# Altium schematic sheet SRAM.SchDoc
size A3
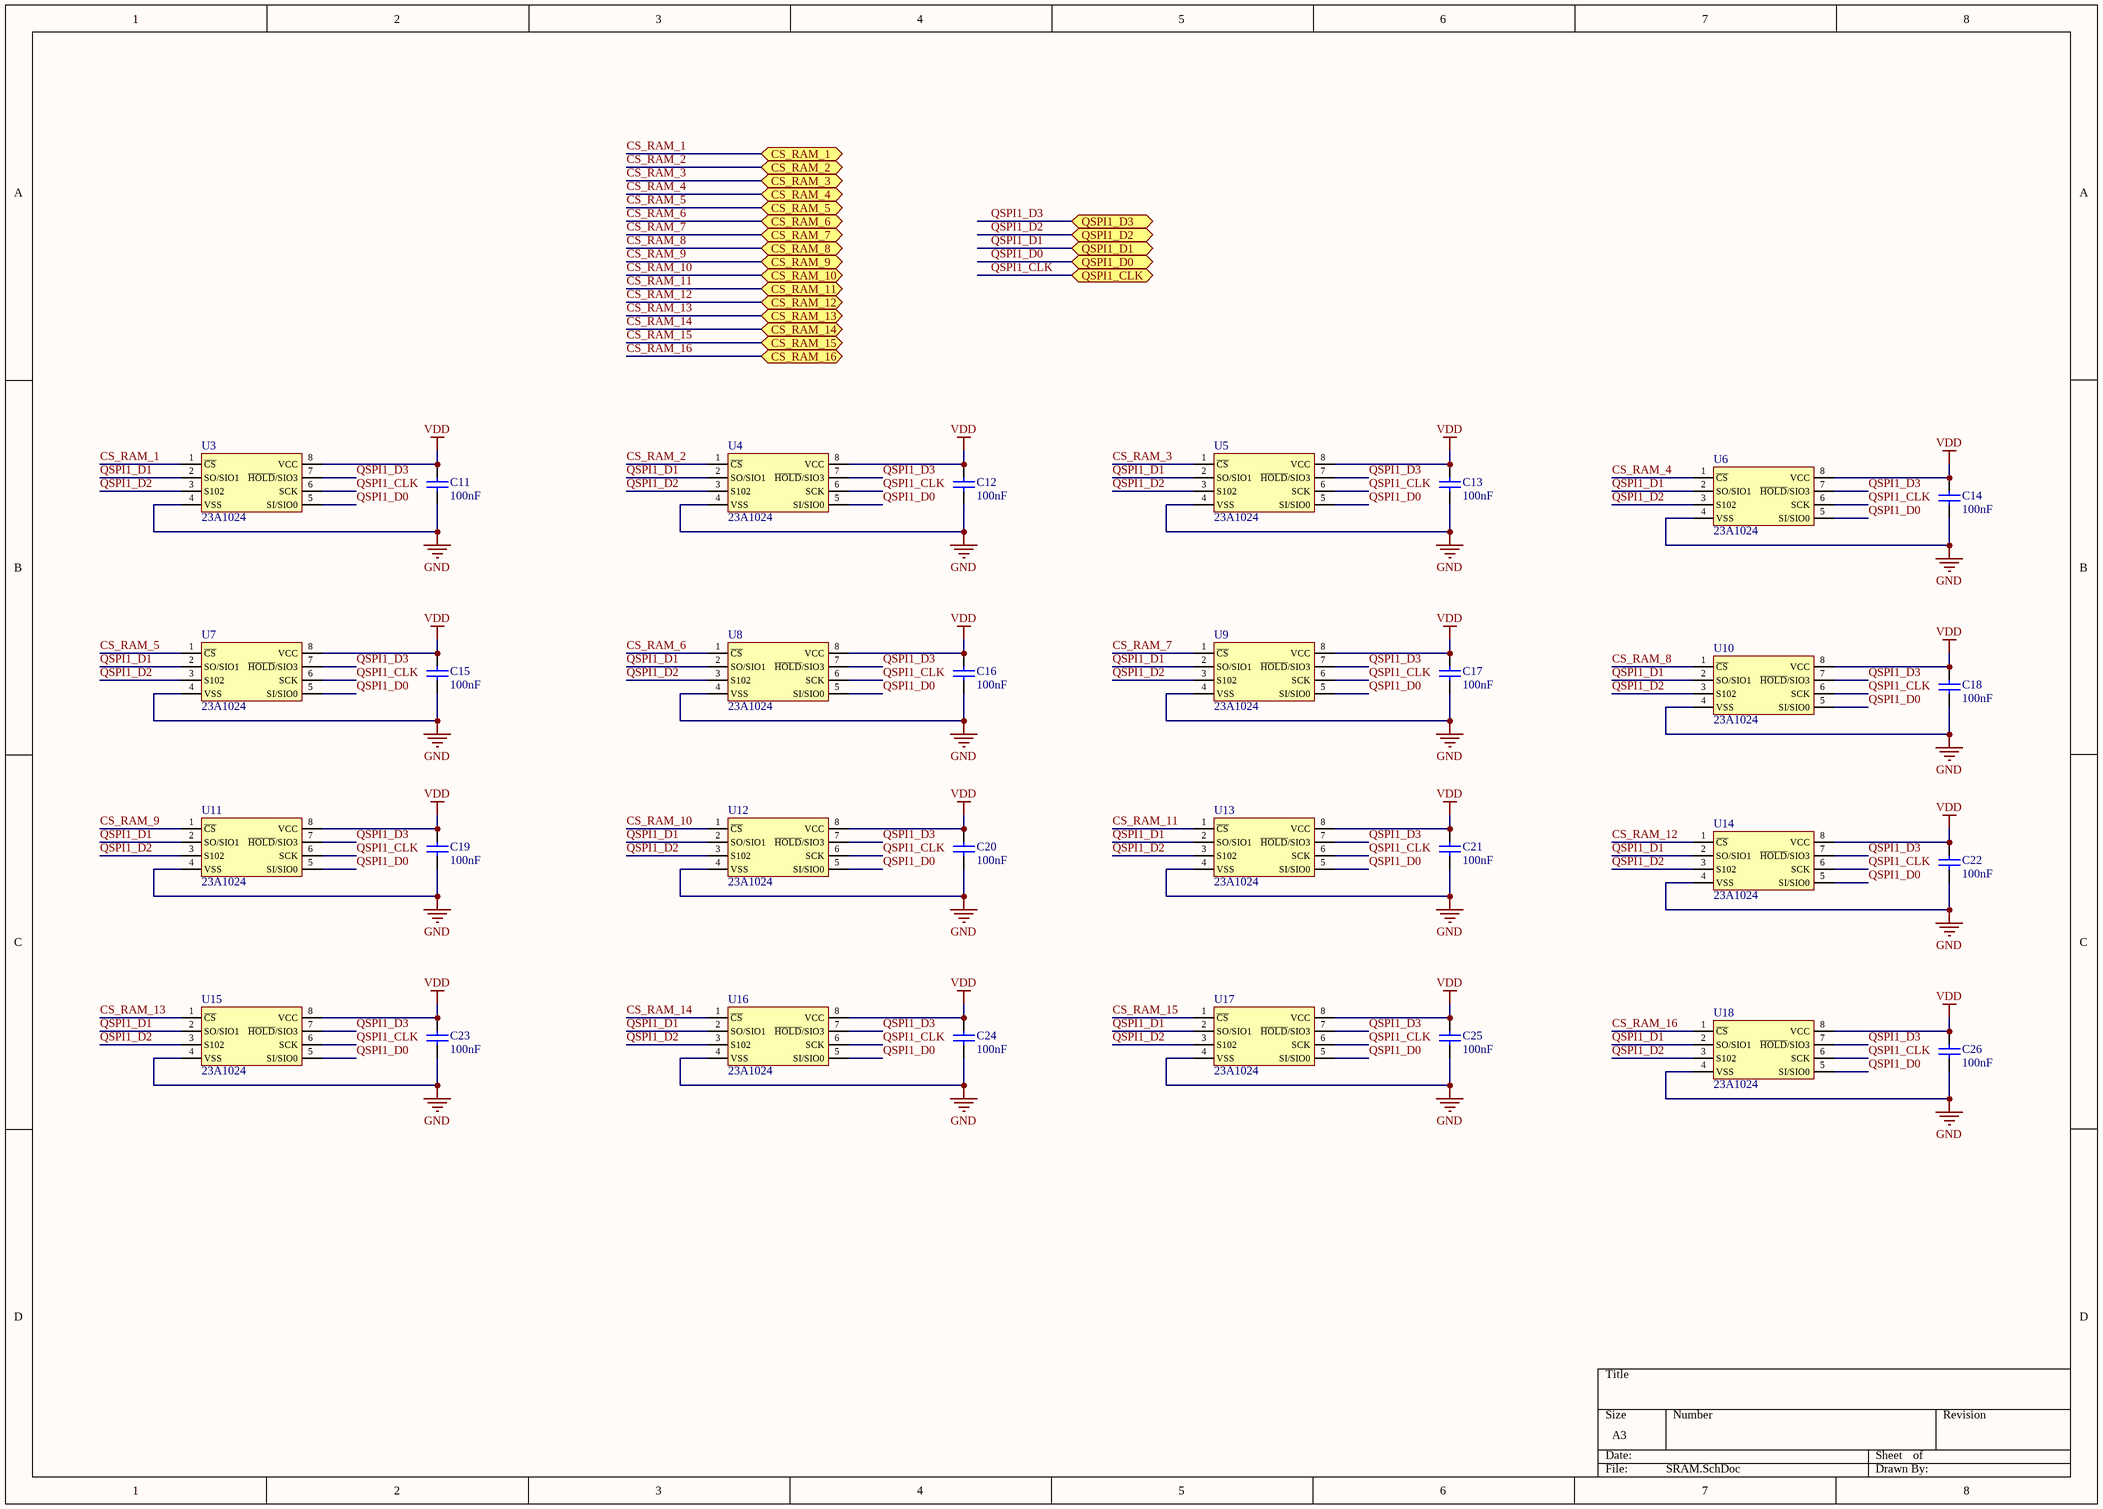
[diagram p0: SRAM.SchDoc]

## Parts
C11  100nF  [0603]
C12  100nF  [0603]
C13  100nF  [0603]
C14  100nF  [0603]
C15  100nF  [0603]
C16  100nF  [0603]
C17  100nF  [0603]
C18  100nF  [0603]
C19  100nF  [0603]
C20  100nF  [0603]
C21  100nF  [0603]
C22  100nF  [0603]
C23  100nF  [0603]
C24  100nF  [0603]
C25  100nF  [0603]
C26  100nF  [0603]
U3  23A1024  [23A1024]
U4  23A1024  [23A1024]
U5  23A1024  [23A1024]
U6  23A1024  [23A1024]
U7  23A1024  [23A1024]
U8  23A1024  [23A1024]
U9  23A1024  [23A1024]
U10  23A1024  [23A1024]
U11  23A1024  [23A1024]
U12  23A1024  [23A1024]
U13  23A1024  [23A1024]
U14  23A1024  [23A1024]
U15  23A1024  [23A1024]
U16  23A1024  [23A1024]
U17  23A1024  [23A1024]
U18  23A1024  [23A1024]

## Ports
CS_RAM_1, CS_RAM_2, CS_RAM_3, CS_RAM_4, CS_RAM_5, CS_RAM_6, CS_RAM_7, CS_RAM_8, CS_RAM_9, CS_RAM_10, CS_RAM_11, CS_RAM_12, CS_RAM_13, CS_RAM_14, CS_RAM_15, CS_RAM_16, QSPI1_CLK, QSPI1_D0, QSPI1_D1, QSPI1_D2, QSPI1_D3

## Nets
GND: C11.2 C12.2 C13.2 C14.2 C15.2 C16.2 C17.2 C18.2 C19.2 C20.2 C21.2 C22.2 C23.2 C24.2 C25.2 C26.2 U3.4(VSS) U4.4(VSS) U5.4(VSS) U6.4(VSS) U7.4(VSS) U8.4(VSS) U9.4(VSS) U10.4(VSS) U11.4(VSS) U12.4(VSS) U13.4(VSS) U14.4(VSS) U15.4(VSS) U16.4(VSS) U17.4(VSS) U18.4(VSS)
VDD: C11.1 C12.1 C13.1 C14.1 C15.1 C16.1 C17.1 C18.1 C19.1 C20.1 C21.1 C22.1 C23.1 C24.1 C25.1 C26.1 U3.8(VCC) U4.8(VCC) U5.8(VCC) U6.8(VCC) U7.8(VCC) U8.8(VCC) U9.8(VCC) U10.8(VCC) U11.8(VCC) U12.8(VCC) U13.8(VCC) U14.8(VCC) U15.8(VCC) U16.8(VCC) U17.8(VCC) U18.8(VCC)
CS_RAM_1: U3.1(~{CS}) ; port CS_RAM_1
CS_RAM_2: U4.1(~{CS}) ; port CS_RAM_2
CS_RAM_3: U5.1(~{CS}) ; port CS_RAM_3
CS_RAM_4: U6.1(~{CS}) ; port CS_RAM_4
CS_RAM_5: U7.1(~{CS}) ; port CS_RAM_5
CS_RAM_6: U8.1(~{CS}) ; port CS_RAM_6
CS_RAM_7: U9.1(~{CS}) ; port CS_RAM_7
CS_RAM_8: U10.1(~{CS}) ; port CS_RAM_8
CS_RAM_9: U11.1(~{CS}) ; port CS_RAM_9
CS_RAM_10: U12.1(~{CS}) ; port CS_RAM_10
CS_RAM_11: U13.1(~{CS}) ; port CS_RAM_11
CS_RAM_12: U14.1(~{CS}) ; port CS_RAM_12
CS_RAM_13: U15.1(~{CS}) ; port CS_RAM_13
CS_RAM_14: U16.1(~{CS}) ; port CS_RAM_14
CS_RAM_15: U17.1(~{CS}) ; port CS_RAM_15
CS_RAM_16: U18.1(~{CS}) ; port CS_RAM_16
QSPI1_CLK: U3.6(SCK) U4.6(SCK) U5.6(SCK) U6.6(SCK) U7.6(SCK) U8.6(SCK) U9.6(SCK) U10.6(SCK) U11.6(SCK) U12.6(SCK) U13.6(SCK) U14.6(SCK) U15.6(SCK) U16.6(SCK) U17.6(SCK) U18.6(SCK) ; port QSPI1_CLK
QSPI1_D0: U3.5(SI/SIO0) U4.5(SI/SIO0) U5.5(SI/SIO0) U6.5(SI/SIO0) U7.5(SI/SIO0) U8.5(SI/SIO0) U9.5(SI/SIO0) U10.5(SI/SIO0) U11.5(SI/SIO0) U12.5(SI/SIO0) U13.5(SI/SIO0) U14.5(SI/SIO0) U15.5(SI/SIO0) U16.5(SI/SIO0) U17.5(SI/SIO0) U18.5(SI/SIO0) ; port QSPI1_D0
QSPI1_D1: U3.2(SO/SIO1) U4.2(SO/SIO1) U5.2(SO/SIO1) U6.2(SO/SIO1) U7.2(SO/SIO1) U8.2(SO/SIO1) U9.2(SO/SIO1) U10.2(SO/SIO1) U11.2(SO/SIO1) U12.2(SO/SIO1) U13.2(SO/SIO1) U14.2(SO/SIO1) U15.2(SO/SIO1) U16.2(SO/SIO1) U17.2(SO/SIO1) U18.2(SO/SIO1) ; port QSPI1_D1
QSPI1_D2: U3.3(S102) U4.3(S102) U5.3(S102) U6.3(S102) U7.3(S102) U8.3(S102) U9.3(S102) U10.3(S102) U11.3(S102) U12.3(S102) U13.3(S102) U14.3(S102) U15.3(S102) U16.3(S102) U17.3(S102) U18.3(S102) ; port QSPI1_D2
QSPI1_D3: U3.7(~{HOLD}/SIO3) U4.7(~{HOLD}/SIO3) U5.7(~{HOLD}/SIO3) U6.7(~{HOLD}/SIO3) U7.7(~{HOLD}/SIO3) U8.7(~{HOLD}/SIO3) U9.7(~{HOLD}/SIO3) U10.7(~{HOLD}/SIO3) U11.7(~{HOLD}/SIO3) U12.7(~{HOLD}/SIO3) U13.7(~{HOLD}/SIO3) U14.7(~{HOLD}/SIO3) U15.7(~{HOLD}/SIO3) U16.7(~{HOLD}/SIO3) U17.7(~{HOLD}/SIO3) U18.7(~{HOLD}/SIO3) ; port QSPI1_D3

## Library data of the parts
C11-C26 = Cap_100nF_X7R_10%_0402: 0201; Manuf_Part_1: CC0402KRX7R7BB104; Manuf_1: YAGEO; Revision: July-2002: Re-released for DXP Platform.; Value: 100nF; Order: CC0402KRX7R7BB104; ECCN_US/EU: n/a
U3-U18 = 23A1024: 1MB 1.8V 1MB QSPI SRAM    MOUSER PART # 579-23A1024-I/SN